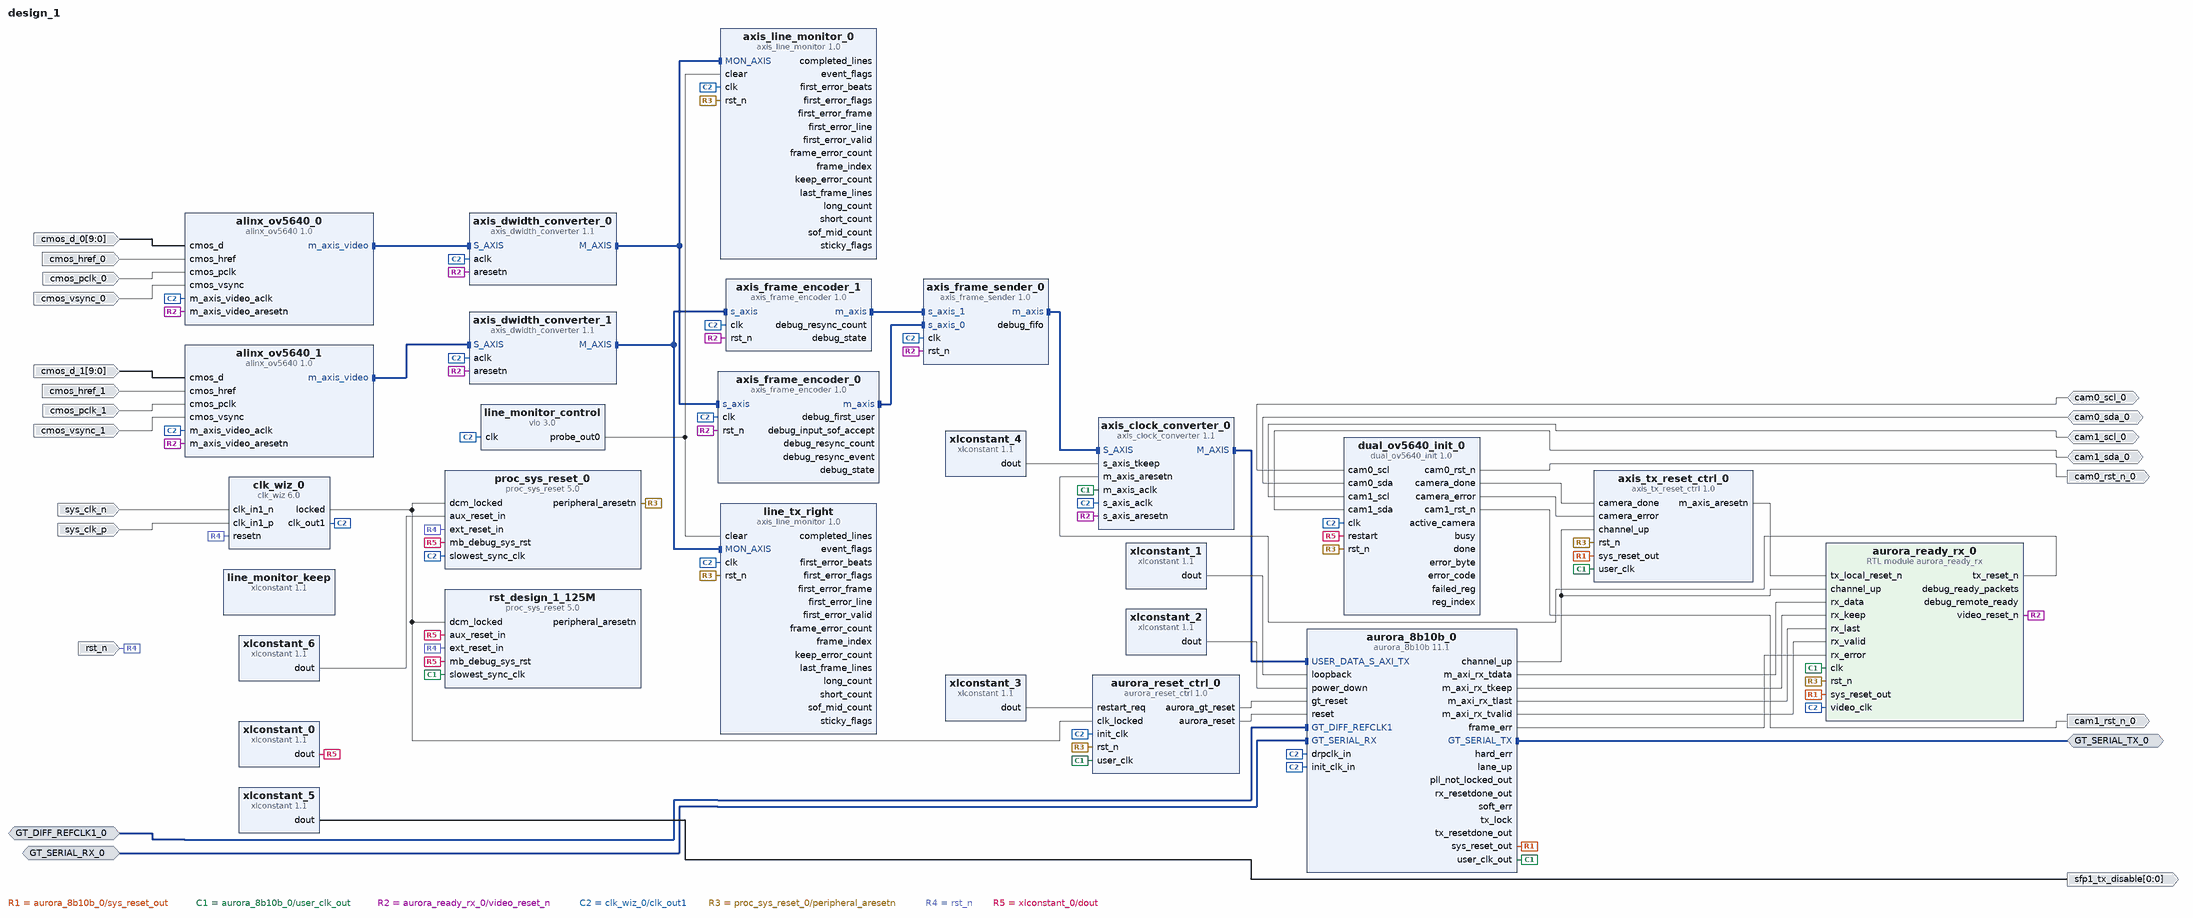
[diagram p0: block diagram of the top level]
# Vivado block design design_1, xc7a35tfgg484-2, Vivado 2023.2
create_bd_design design_1

create_bd_intf_port -mode Slave -vlnv xilinx.com:interface:diff_clock_rtl:1.0 GT_DIFF_REFCLK1_0
set_property -dict {CONFIG.FREQ_HZ 125000000} [get_bd_intf_ports GT_DIFF_REFCLK1_0]
create_bd_intf_port -mode Slave -vlnv xilinx.com:display_aurora:GT_Serial_Transceiver_Pins_RX_rtl:1.0 GT_SERIAL_RX_0
create_bd_intf_port -mode Master -vlnv xilinx.com:display_aurora:GT_Serial_Transceiver_Pins_TX_rtl:1.0 GT_SERIAL_TX_0
create_bd_port -dir O -type rst cam0_rst_n_0
create_bd_port -dir IO cam0_scl_0
create_bd_port -dir IO cam0_sda_0
create_bd_port -dir O -type rst cam1_rst_n_0
create_bd_port -dir IO cam1_scl_0
create_bd_port -dir IO cam1_sda_0
create_bd_port -dir I -from 9 -to 0 cmos_d_0
create_bd_port -dir I cmos_href_0
create_bd_port -dir I cmos_pclk_0
create_bd_port -dir I cmos_vsync_0
create_bd_port -dir I -from 9 -to 0 cmos_d_1
create_bd_port -dir I cmos_href_1
create_bd_port -dir I cmos_pclk_1
create_bd_port -dir I cmos_vsync_1
create_bd_port -dir I -type rst rst_n
set_property -dict {CONFIG.POLARITY ACTIVE_LOW} [get_bd_ports rst_n]
create_bd_port -dir I -type clk sys_clk_p
set_property -dict {CONFIG.FREQ_HZ 200000000} [get_bd_ports sys_clk_p]
create_bd_port -dir I -type clk sys_clk_n
set_property -dict {CONFIG.FREQ_HZ 200000000} [get_bd_ports sys_clk_n]
create_bd_port -dir O -from 0 -to 0 sfp1_tx_disable

create_bd_cell -type ip -vlnv xilinx.com:user:dual_ov5640_init:1.0 dual_ov5640_init_0
create_bd_cell -type ip -vlnv xilinx.com:user:alinx_ov5640:1.0 alinx_ov5640_0
set_property -dict {CONFIG.BUFFER_DEPTH 8192 CONFIG.DEBUG_OV5640 0} [get_bd_cells alinx_ov5640_0]
create_bd_cell -type ip -vlnv xilinx.com:user:alinx_ov5640:1.0 alinx_ov5640_1
set_property -dict {CONFIG.BUFFER_DEPTH 8192 CONFIG.DEBUG_OV5640 0} [get_bd_cells alinx_ov5640_1]
create_bd_cell -type ip -vlnv xilinx.com:ip:axis_dwidth_converter:1.1 axis_dwidth_converter_0
set_property -dict [list \
  CONFIG.HAS_TKEEP 1 \
  CONFIG.HAS_TLAST 1 \
  CONFIG.M_TDATA_NUM_BYTES 4 \
  CONFIG.S_TDATA_NUM_BYTES 2 \
  CONFIG.TUSER_BITS_PER_BYTE 1 \
] [get_bd_cells axis_dwidth_converter_0]
create_bd_cell -type ip -vlnv xilinx.com:ip:axis_dwidth_converter:1.1 axis_dwidth_converter_1
set_property -dict [list \
  CONFIG.HAS_TKEEP 1 \
  CONFIG.HAS_TLAST 1 \
  CONFIG.M_TDATA_NUM_BYTES 4 \
  CONFIG.S_TDATA_NUM_BYTES 2 \
  CONFIG.TUSER_BITS_PER_BYTE 1 \
] [get_bd_cells axis_dwidth_converter_1]
create_bd_cell -type ip -vlnv xilinx.com:ip:xlconstant:1.1 xlconstant_0
set_property -dict {CONFIG.CONST_VAL 0} [get_bd_cells xlconstant_0]
create_bd_cell -type ip -vlnv xilinx.com:ip:clk_wiz:6.0 clk_wiz_0
set_property -dict [list \
  CONFIG.CLKIN1_JITTER_PS 50.0 \
  CONFIG.CLKOUT1_JITTER 129.198 \
  CONFIG.CLKOUT1_PHASE_ERROR 89.971 \
  CONFIG.CLKOUT1_REQUESTED_OUT_FREQ 50.000 \
  CONFIG.MMCM_CLKFBOUT_MULT_F 5.000 \
  CONFIG.MMCM_CLKIN1_PERIOD 5.000 \
  CONFIG.MMCM_CLKIN2_PERIOD 10.0 \
  CONFIG.MMCM_CLKOUT0_DIVIDE_F 20.000 \
  CONFIG.PRIM_IN_FREQ 200.000 \
  CONFIG.PRIM_SOURCE Differential_clock_capable_pin \
  CONFIG.RESET_PORT resetn \
  CONFIG.RESET_TYPE ACTIVE_LOW \
  CONFIG.USE_LOCKED true \
] [get_bd_cells clk_wiz_0]
create_bd_cell -type ip -vlnv xilinx.com:ip:proc_sys_reset:5.0 proc_sys_reset_0
create_bd_cell -type ip -vlnv xilinx.com:ip:aurora_8b10b:11.1 aurora_8b10b_0
set_property -dict [list \
  CONFIG.C_DRP_IF true \
  CONFIG.C_LANE_WIDTH 4 \
  CONFIG.C_LINE_RATE 2.5 \
  CONFIG.Dataflow_Config Duplex \
  CONFIG.SINGLEEND_INITCLK true \
  CONFIG.SupportLevel 1 \
] [get_bd_cells aurora_8b10b_0]
create_bd_cell -type ip -vlnv xilinx.com:ip:axis_clock_converter:1.1 axis_clock_converter_0
set_property -dict {CONFIG.HAS_TKEEP 1 CONFIG.HAS_TLAST 1 CONFIG.TDATA_NUM_BYTES 4} [get_bd_cells axis_clock_converter_0]
create_bd_cell -type ip -vlnv xilinx.com:ip:xlconstant:1.1 xlconstant_1
set_property -dict {CONFIG.CONST_VAL 0 CONFIG.CONST_WIDTH 3} [get_bd_cells xlconstant_1]
create_bd_cell -type ip -vlnv xilinx.com:ip:xlconstant:1.1 xlconstant_2
set_property -dict {CONFIG.CONST_VAL 0} [get_bd_cells xlconstant_2]
create_bd_cell -type ip -vlnv xilinx.com:user:aurora_reset_ctrl:1.0 aurora_reset_ctrl_0
create_bd_cell -type ip -vlnv xilinx.com:ip:xlconstant:1.1 xlconstant_3
set_property -dict {CONFIG.CONST_VAL 0} [get_bd_cells xlconstant_3]
create_bd_cell -type ip -vlnv xilinx.com:ip:xlconstant:1.1 xlconstant_4
set_property -dict {CONFIG.CONST_VAL 15 CONFIG.CONST_WIDTH 4} [get_bd_cells xlconstant_4]
create_bd_cell -type ip -vlnv xilinx.com:user:axis_tx_reset_ctrl:1.0 axis_tx_reset_ctrl_0
create_bd_cell -type ip -vlnv xilinx.com:ip:xlconstant:1.1 xlconstant_5
set_property -dict {CONFIG.CONST_VAL 0} [get_bd_cells xlconstant_5]
create_bd_cell -type ip -vlnv xilinx.com:ip:xlconstant:1.1 xlconstant_6
create_bd_cell -type ip -vlnv xilinx.com:ip:proc_sys_reset:5.0 rst_design_1_125M
set_property -dict {CONFIG.C_AUX_RESET_HIGH 1} [get_bd_cells rst_design_1_125M]
create_bd_cell -type ip -vlnv xilinx.com:ip:vio:3.0 line_monitor_control
set_property -dict [list \
  CONFIG.C_NUM_PROBE_IN 0 \
  CONFIG.C_NUM_PROBE_OUT 1 \
  CONFIG.C_PROBE_OUT0_INIT_VAL 0000 \
  CONFIG.C_PROBE_OUT0_WIDTH 1 \
] [get_bd_cells line_monitor_control]
create_bd_cell -type ip -vlnv xilinx.com:ip:xlconstant:1.1 line_monitor_keep
set_property -dict {CONFIG.CONST_VAL 15 CONFIG.CONST_WIDTH 4} [get_bd_cells line_monitor_keep]
create_bd_cell -type ip -vlnv user.org:user:axis_line_monitor:1.0 axis_line_monitor_0
set_property -dict [list \
  CONFIG.CHECK_KEEP 1 \
  CONFIG.DATA_BYTES 4 \
  CONFIG.EXPECTED_BEATS 640 \
  CONFIG.EXPECTED_LINES 720 \
  CONFIG.IDLE_TIMEOUT_CYCLES 0 \
  CONFIG.USER_WIDTH 4 \
] [get_bd_cells axis_line_monitor_0]
create_bd_cell -type ip -vlnv user.org:user:axis_line_monitor:1.0 line_tx_right
set_property -dict [list \
  CONFIG.CHECK_KEEP 1 \
  CONFIG.DATA_BYTES 4 \
  CONFIG.EXPECTED_BEATS 640 \
  CONFIG.EXPECTED_LINES 720 \
  CONFIG.IDLE_TIMEOUT_CYCLES 0 \
  CONFIG.USER_WIDTH 4 \
] [get_bd_cells line_tx_right]
create_bd_cell -type ip -vlnv xilinx.com:user:axis_frame_encoder:1.0 axis_frame_encoder_0
set_property -dict {CONFIG.ROUTE_ID 0x0001 CONFIG.USER_WIDTH 4} [get_bd_cells axis_frame_encoder_0]
create_bd_cell -type ip -vlnv xilinx.com:user:axis_frame_encoder:1.0 axis_frame_encoder_1
set_property -dict {CONFIG.ROUTE_ID 0x0002 CONFIG.USER_WIDTH 4} [get_bd_cells axis_frame_encoder_1]
create_bd_cell -type ip -vlnv xilinx.com:user:axis_frame_sender:1.0 axis_frame_sender_0
set_property -dict {CONFIG.FIFO_DEPTH 2048} [get_bd_cells axis_frame_sender_0]
create_bd_cell -type module -reference aurora_ready_rx aurora_ready_rx_0

# ---- connections ----

connect_bd_intf_net -intf_net GT_DIFF_REFCLK1_0_1 [get_bd_intf_ports GT_DIFF_REFCLK1_0] [get_bd_intf_pins aurora_8b10b_0/GT_DIFF_REFCLK1]
connect_bd_intf_net -intf_net GT_SERIAL_RX_0_1 [get_bd_intf_ports GT_SERIAL_RX_0] [get_bd_intf_pins aurora_8b10b_0/GT_SERIAL_RX]
connect_bd_intf_net [get_bd_intf_pins alinx_ov5640_0/m_axis_video] [get_bd_intf_pins axis_dwidth_converter_0/S_AXIS]
connect_bd_intf_net [get_bd_intf_pins alinx_ov5640_1/m_axis_video] [get_bd_intf_pins axis_dwidth_converter_1/S_AXIS]
connect_bd_intf_net [get_bd_intf_ports GT_SERIAL_TX_0] [get_bd_intf_pins aurora_8b10b_0/GT_SERIAL_TX]
connect_bd_intf_net [get_bd_intf_pins axis_clock_converter_0/M_AXIS] [get_bd_intf_pins aurora_8b10b_0/USER_DATA_S_AXI_TX]
connect_bd_intf_net [get_bd_intf_pins axis_dwidth_converter_0/M_AXIS] [get_bd_intf_pins axis_frame_encoder_0/s_axis]
connect_bd_intf_net [get_bd_intf_pins axis_dwidth_converter_0/M_AXIS] [get_bd_intf_pins axis_line_monitor_0/MON_AXIS]
connect_bd_intf_net [get_bd_intf_pins axis_dwidth_converter_1/M_AXIS] [get_bd_intf_pins axis_frame_encoder_1/s_axis]
connect_bd_intf_net [get_bd_intf_pins axis_dwidth_converter_1/M_AXIS] [get_bd_intf_pins line_tx_right/MON_AXIS]
connect_bd_intf_net -intf_net axis_frame_encoder_0_m_axis [get_bd_intf_pins axis_frame_sender_0/m_axis] [get_bd_intf_pins axis_clock_converter_0/S_AXIS]
connect_bd_intf_net [get_bd_intf_pins axis_frame_encoder_0/m_axis] [get_bd_intf_pins axis_frame_sender_0/s_axis_0]
connect_bd_intf_net [get_bd_intf_pins axis_frame_encoder_1/m_axis] [get_bd_intf_pins axis_frame_sender_0/s_axis_1]
connect_bd_net [get_bd_ports cam0_scl_0] [get_bd_pins dual_ov5640_init_0/cam0_scl]
connect_bd_net [get_bd_ports cam0_sda_0] [get_bd_pins dual_ov5640_init_0/cam0_sda]
connect_bd_net [get_bd_ports cam1_scl_0] [get_bd_pins dual_ov5640_init_0/cam1_scl]
connect_bd_net [get_bd_ports cam1_sda_0] [get_bd_pins dual_ov5640_init_0/cam1_sda]
# net active_camera has one end: dual_ov5640_init_0/active_camera
connect_bd_net [get_bd_pins aurora_8b10b_0/m_axi_rx_tdata] [get_bd_pins aurora_ready_rx_0/rx_data]
connect_bd_net [get_bd_pins aurora_8b10b_0/m_axi_rx_tkeep] [get_bd_pins aurora_ready_rx_0/rx_keep]
connect_bd_net [get_bd_pins aurora_8b10b_0/m_axi_rx_tlast] [get_bd_pins aurora_ready_rx_0/rx_last]
connect_bd_net [get_bd_pins aurora_8b10b_0/m_axi_rx_tvalid] [get_bd_pins aurora_ready_rx_0/rx_valid]
connect_bd_net [get_bd_pins aurora_8b10b_0/sys_reset_out] \
  [get_bd_pins axis_tx_reset_ctrl_0/sys_reset_out] [get_bd_pins aurora_ready_rx_0/sys_reset_out]
connect_bd_net [get_bd_pins aurora_8b10b_0/user_clk_out] \
  [get_bd_pins axis_clock_converter_0/m_axis_aclk] [get_bd_pins aurora_reset_ctrl_0/user_clk] \
  [get_bd_pins axis_tx_reset_ctrl_0/user_clk] [get_bd_pins rst_design_1_125M/slowest_sync_clk] \
  [get_bd_pins aurora_ready_rx_0/clk]
# net aurora_ready_rx_0_debug_ready_packets has one end: aurora_ready_rx_0/debug_ready_packets
# net aurora_ready_rx_0_debug_remote_ready has one end: aurora_ready_rx_0/debug_remote_ready
connect_bd_net [get_bd_pins aurora_ready_rx_0/tx_reset_n] [get_bd_pins axis_clock_converter_0/m_axis_aresetn]
connect_bd_net [get_bd_pins aurora_ready_rx_0/video_reset_n] \
  [get_bd_pins alinx_ov5640_0/m_axis_video_aresetn] [get_bd_pins alinx_ov5640_1/m_axis_video_aresetn] \
  [get_bd_pins axis_dwidth_converter_0/aresetn] [get_bd_pins axis_dwidth_converter_1/aresetn] \
  [get_bd_pins axis_frame_encoder_0/rst_n] [get_bd_pins axis_frame_encoder_1/rst_n] [get_bd_pins axis_frame_sender_0/rst_n] \
  [get_bd_pins axis_clock_converter_0/s_axis_aresetn]
connect_bd_net [get_bd_pins aurora_reset_ctrl_0/aurora_gt_reset] [get_bd_pins aurora_8b10b_0/gt_reset]
connect_bd_net [get_bd_pins aurora_reset_ctrl_0/aurora_reset] [get_bd_pins aurora_8b10b_0/reset]
# net axis_frame_encoder_1_debug_resync_count has one end: axis_frame_encoder_1/debug_resync_count
# net axis_frame_encoder_1_debug_state has one end: axis_frame_encoder_1/debug_state
# net axis_frame_sender_0_debug_fifo has one end: axis_frame_sender_0/debug_fifo
# net axis_line_monitor_0_completed_lines has one end: axis_line_monitor_0/completed_lines
# net axis_line_monitor_0_event_flags has one end: axis_line_monitor_0/event_flags
# net axis_line_monitor_0_first_error_beats has one end: axis_line_monitor_0/first_error_beats
# net axis_line_monitor_0_first_error_flags has one end: axis_line_monitor_0/first_error_flags
# net axis_line_monitor_0_first_error_frame has one end: axis_line_monitor_0/first_error_frame
# net axis_line_monitor_0_first_error_line has one end: axis_line_monitor_0/first_error_line
# net axis_line_monitor_0_first_error_valid has one end: axis_line_monitor_0/first_error_valid
# net axis_line_monitor_0_frame_error_count has one end: axis_line_monitor_0/frame_error_count
# net axis_line_monitor_0_frame_index has one end: axis_line_monitor_0/frame_index
# net axis_line_monitor_0_keep_error_count has one end: axis_line_monitor_0/keep_error_count
# net axis_line_monitor_0_last_frame_lines has one end: axis_line_monitor_0/last_frame_lines
# net axis_line_monitor_0_long_count has one end: axis_line_monitor_0/long_count
# net axis_line_monitor_0_short_count has one end: axis_line_monitor_0/short_count
# net axis_line_monitor_0_sof_mid_count has one end: axis_line_monitor_0/sof_mid_count
# net axis_line_monitor_0_sticky_flags has one end: axis_line_monitor_0/sticky_flags
connect_bd_net [get_bd_pins axis_tx_reset_ctrl_0/m_axis_aresetn] [get_bd_pins aurora_ready_rx_0/tx_local_reset_n]
# net busy has one end: dual_ov5640_init_0/busy
connect_bd_net -net camera_done [get_bd_pins dual_ov5640_init_0/camera_done] [get_bd_pins axis_tx_reset_ctrl_0/camera_done]
connect_bd_net -net camera_error [get_bd_pins dual_ov5640_init_0/camera_error] [get_bd_pins axis_tx_reset_ctrl_0/camera_error]
connect_bd_net -net channel_up [get_bd_pins aurora_8b10b_0/channel_up] \
  [get_bd_pins axis_tx_reset_ctrl_0/channel_up] [get_bd_pins aurora_ready_rx_0/channel_up]
connect_bd_net [get_bd_pins clk_wiz_0/locked] \
  [get_bd_pins proc_sys_reset_0/dcm_locked] [get_bd_pins aurora_reset_ctrl_0/clk_locked] \
  [get_bd_pins rst_design_1_125M/dcm_locked]
connect_bd_net -net cmos_d_0_1 [get_bd_ports cmos_d_0] [get_bd_pins alinx_ov5640_0/cmos_d]
connect_bd_net -net cmos_d_1_1 [get_bd_ports cmos_d_1] [get_bd_pins alinx_ov5640_1/cmos_d]
connect_bd_net -net cmos_href_0_1 [get_bd_ports cmos_href_0] [get_bd_pins alinx_ov5640_0/cmos_href]
connect_bd_net -net cmos_href_1_1 [get_bd_ports cmos_href_1] [get_bd_pins alinx_ov5640_1/cmos_href]
connect_bd_net -net cmos_pclk_0_1 [get_bd_ports cmos_pclk_0] [get_bd_pins alinx_ov5640_0/cmos_pclk]
connect_bd_net -net cmos_pclk_1_1 [get_bd_ports cmos_pclk_1] [get_bd_pins alinx_ov5640_1/cmos_pclk]
connect_bd_net -net cmos_vsync_0_1 [get_bd_ports cmos_vsync_0] [get_bd_pins alinx_ov5640_0/cmos_vsync]
connect_bd_net -net cmos_vsync_1_1 [get_bd_ports cmos_vsync_1] [get_bd_pins alinx_ov5640_1/cmos_vsync]
# net debug_first_user has one end: axis_frame_encoder_0/debug_first_user
# net debug_input_sof_accept has one end: axis_frame_encoder_0/debug_input_sof_accept
# net debug_resync_count has one end: axis_frame_encoder_0/debug_resync_count
# net debug_resync_event has one end: axis_frame_encoder_0/debug_resync_event
# net debug_state has one end: axis_frame_encoder_0/debug_state
# net done has one end: dual_ov5640_init_0/done
connect_bd_net [get_bd_pins dual_ov5640_init_0/cam0_rst_n] [get_bd_ports cam0_rst_n_0]
connect_bd_net [get_bd_pins dual_ov5640_init_0/cam1_rst_n] [get_bd_ports cam1_rst_n_0]
# net error_byte has one end: dual_ov5640_init_0/error_byte
# net error_code has one end: dual_ov5640_init_0/error_code
# net failed_reg has one end: dual_ov5640_init_0/failed_reg
connect_bd_net -net frame_err [get_bd_pins aurora_8b10b_0/frame_err] [get_bd_pins aurora_ready_rx_0/rx_error]
# net hard_err has one end: aurora_8b10b_0/hard_err
# net lane_up has one end: aurora_8b10b_0/lane_up
connect_bd_net [get_bd_pins line_monitor_control/probe_out0] [get_bd_pins axis_line_monitor_0/clear] [get_bd_pins line_tx_right/clear]
# net line_tx_right_completed_lines has one end: line_tx_right/completed_lines
# net line_tx_right_event_flags has one end: line_tx_right/event_flags
# net line_tx_right_first_error_beats has one end: line_tx_right/first_error_beats
# net line_tx_right_first_error_flags has one end: line_tx_right/first_error_flags
# net line_tx_right_first_error_frame has one end: line_tx_right/first_error_frame
# net line_tx_right_first_error_line has one end: line_tx_right/first_error_line
# net line_tx_right_first_error_valid has one end: line_tx_right/first_error_valid
# net line_tx_right_frame_error_count has one end: line_tx_right/frame_error_count
# net line_tx_right_frame_index has one end: line_tx_right/frame_index
# net line_tx_right_keep_error_count has one end: line_tx_right/keep_error_count
# net line_tx_right_last_frame_lines has one end: line_tx_right/last_frame_lines
# net line_tx_right_long_count has one end: line_tx_right/long_count
# net line_tx_right_short_count has one end: line_tx_right/short_count
# net line_tx_right_sof_mid_count has one end: line_tx_right/sof_mid_count
# net line_tx_right_sticky_flags has one end: line_tx_right/sticky_flags
connect_bd_net -net m_axis_video_aclk_0_1 [get_bd_pins clk_wiz_0/clk_out1] \
  [get_bd_pins axis_dwidth_converter_0/aclk] [get_bd_pins axis_dwidth_converter_1/aclk] [get_bd_pins dual_ov5640_init_0/clk] \
  [get_bd_pins proc_sys_reset_0/slowest_sync_clk] [get_bd_pins axis_clock_converter_0/s_axis_aclk] \
  [get_bd_pins aurora_reset_ctrl_0/init_clk] [get_bd_pins aurora_8b10b_0/drpclk_in] [get_bd_pins aurora_8b10b_0/init_clk_in] \
  [get_bd_pins line_monitor_control/clk] [get_bd_pins axis_line_monitor_0/clk] [get_bd_pins line_tx_right/clk] \
  [get_bd_pins axis_frame_encoder_0/clk] [get_bd_pins axis_frame_encoder_1/clk] [get_bd_pins axis_frame_sender_0/clk] \
  [get_bd_pins alinx_ov5640_0/m_axis_video_aclk] [get_bd_pins alinx_ov5640_1/m_axis_video_aclk] \
  [get_bd_pins aurora_ready_rx_0/video_clk]
# net pll_not_locked_out has one end: aurora_8b10b_0/pll_not_locked_out
connect_bd_net [get_bd_pins proc_sys_reset_0/peripheral_aresetn] \
  [get_bd_pins dual_ov5640_init_0/rst_n] [get_bd_pins aurora_reset_ctrl_0/rst_n] [get_bd_pins axis_tx_reset_ctrl_0/rst_n] \
  [get_bd_pins axis_line_monitor_0/rst_n] [get_bd_pins line_tx_right/rst_n] [get_bd_pins aurora_ready_rx_0/rst_n]
# net reg_index has one end: dual_ov5640_init_0/reg_index
# net rst_design_1_125M_peripheral_aresetn has one end: rst_design_1_125M/peripheral_aresetn
connect_bd_net [get_bd_ports rst_n] \
  [get_bd_pins clk_wiz_0/resetn] [get_bd_pins proc_sys_reset_0/ext_reset_in] [get_bd_pins rst_design_1_125M/ext_reset_in]
# net rx_resetdone_out has one end: aurora_8b10b_0/rx_resetdone_out
# net soft_err has one end: aurora_8b10b_0/soft_err
connect_bd_net [get_bd_ports sys_clk_n] [get_bd_pins clk_wiz_0/clk_in1_n]
connect_bd_net [get_bd_ports sys_clk_p] [get_bd_pins clk_wiz_0/clk_in1_p]
# net tx_lock has one end: aurora_8b10b_0/tx_lock
# net tx_resetdone_out has one end: aurora_8b10b_0/tx_resetdone_out
connect_bd_net [get_bd_pins xlconstant_0/dout] \
  [get_bd_pins dual_ov5640_init_0/restart] [get_bd_pins proc_sys_reset_0/mb_debug_sys_rst] \
  [get_bd_pins rst_design_1_125M/aux_reset_in] [get_bd_pins rst_design_1_125M/mb_debug_sys_rst]
connect_bd_net [get_bd_pins xlconstant_1/dout] [get_bd_pins aurora_8b10b_0/loopback]
connect_bd_net [get_bd_pins xlconstant_2/dout] [get_bd_pins aurora_8b10b_0/power_down]
connect_bd_net [get_bd_pins xlconstant_3/dout] [get_bd_pins aurora_reset_ctrl_0/restart_req]
connect_bd_net [get_bd_pins xlconstant_4/dout] [get_bd_pins axis_clock_converter_0/s_axis_tkeep]
connect_bd_net [get_bd_pins xlconstant_5/dout] [get_bd_ports sfp1_tx_disable]
connect_bd_net [get_bd_pins xlconstant_6/dout] [get_bd_pins proc_sys_reset_0/aux_reset_in]

validate_bd_design
save_bd_design
